# Altium project Zulu_a7_no_pmod.PrjPcb (part 3 of 3)

## Sheet zulu_a7_5.SchDoc
size 277 x 341 mm; Author: Christian Tambe; VERSION#: 1.0; Origin: Eagle; OriginPath: C:\Users\tambe\Documents\Electronics\Zulu_A7\Zulu_Altrium\zulu_a7.sch; OriginSheet: 6; OriginDescription: FPGA Connections
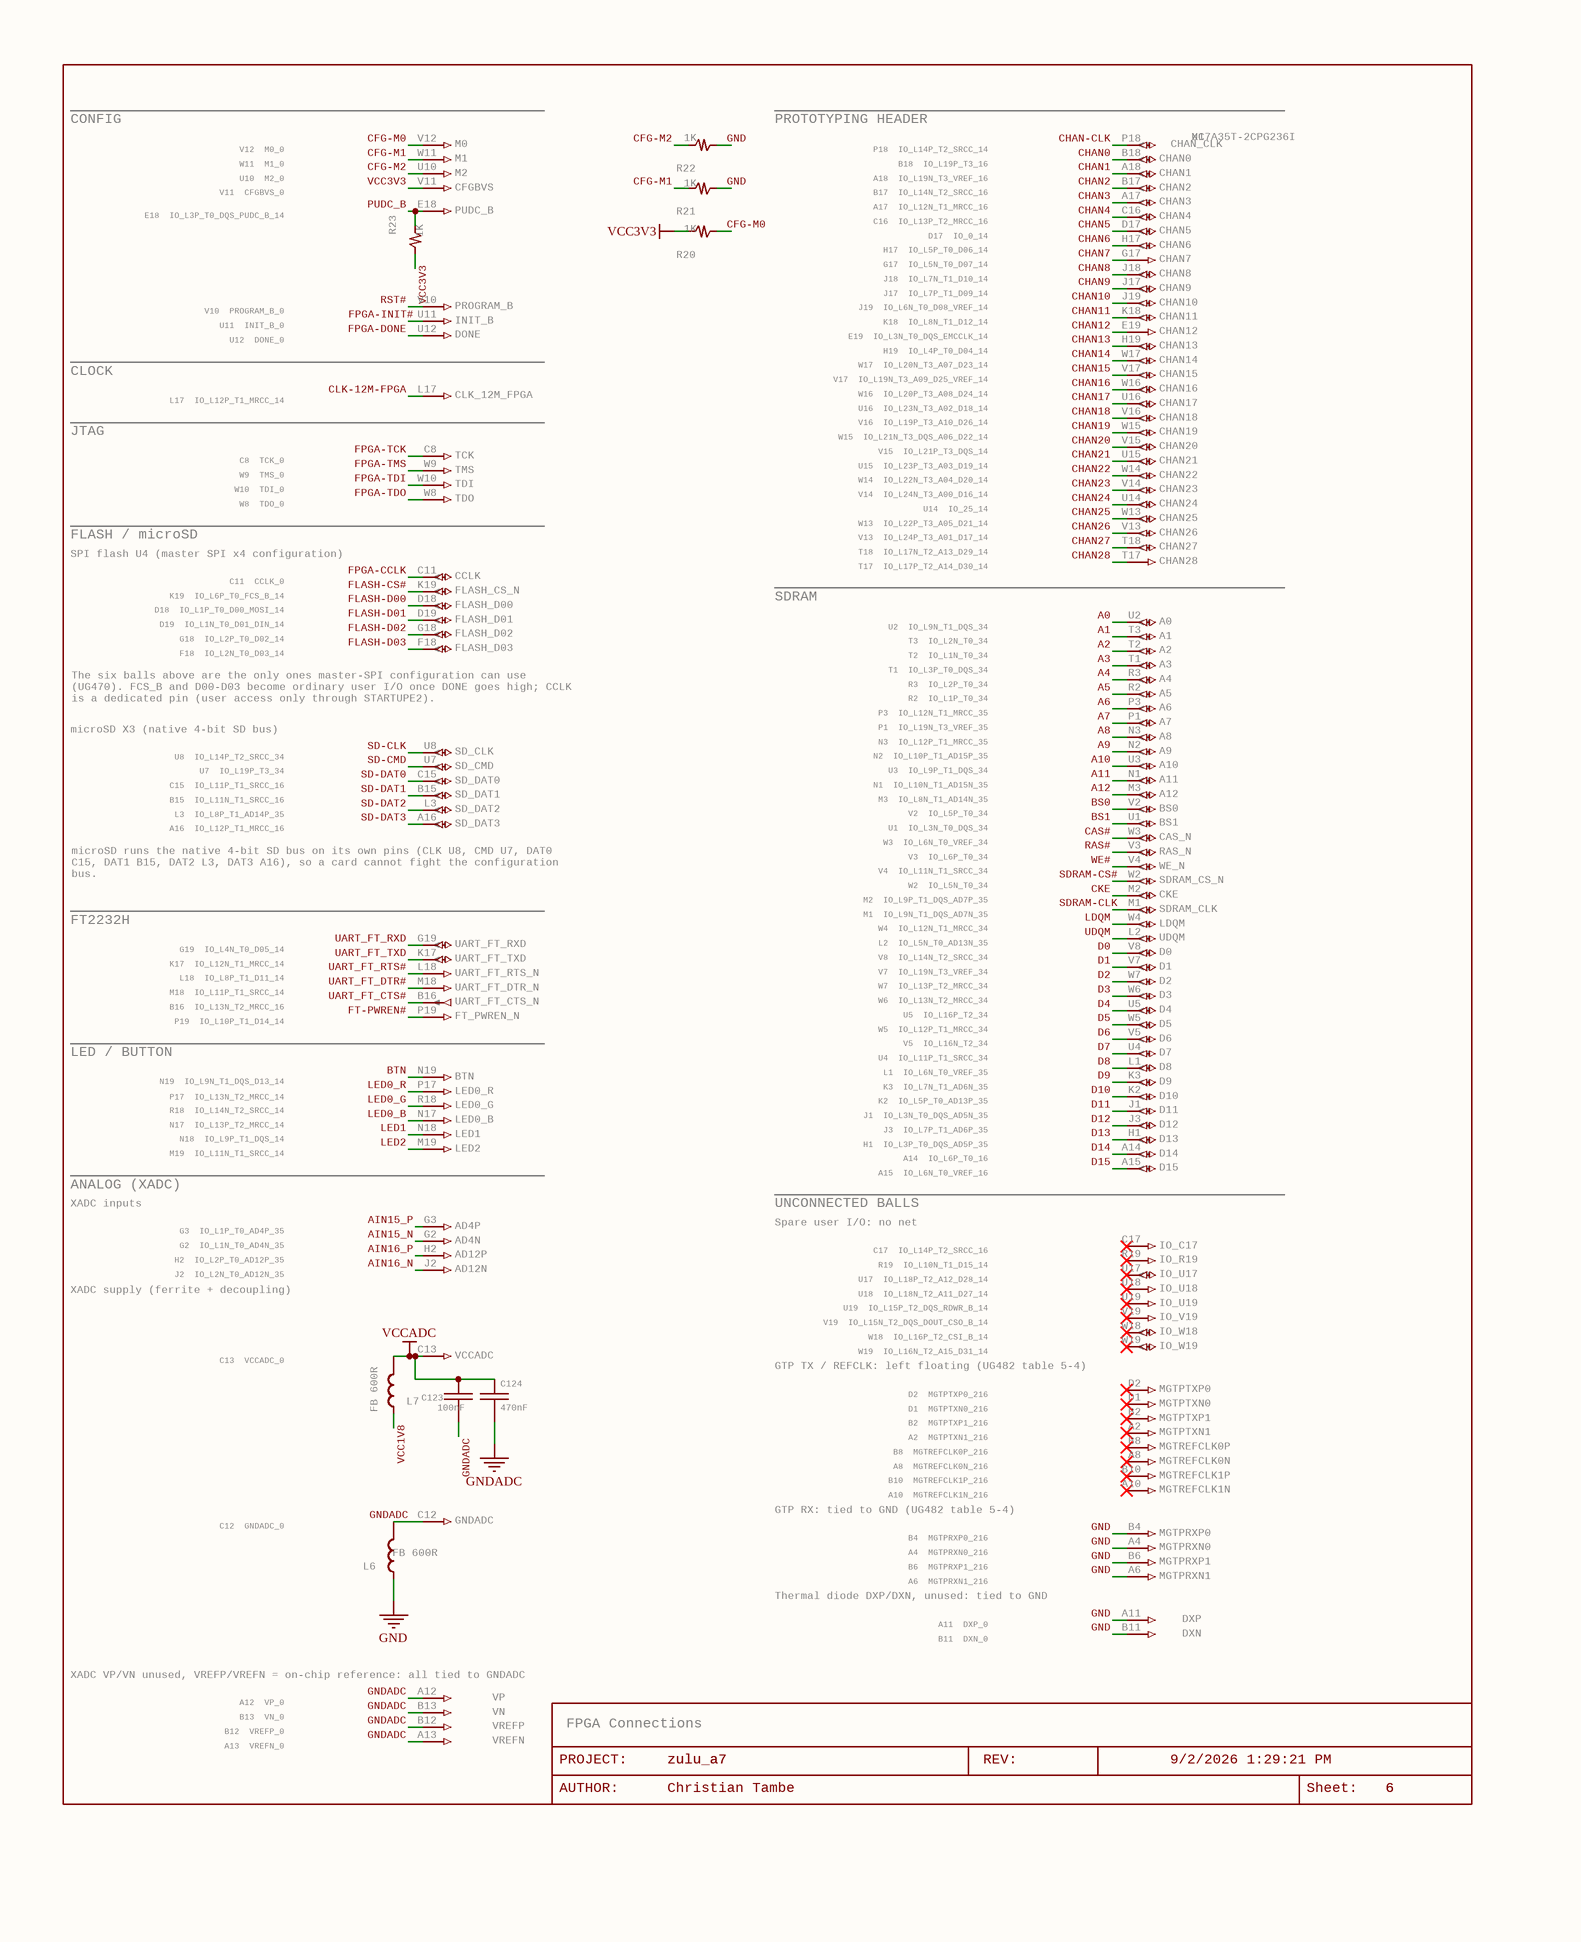
[diagram p5: zulu_a7_5.SchDoc]

### Parts
C123  100nF  [C0201]
C124  470nF  [C0402]
FRAME2  LAST_DATE_TIME: 9/2/2026 1:29:21 PM  Sheet: Sheet:  SHEET: 6  REV: REV:  PROJECT: PROJECT:  DRAWING_NAME: zulu_a7  AUTHOR: Christian Tambe  (hidden comment: DOCFIELD)  (graphical)
L6  FB 600R  [IND0603]
L7  FB 600R  [IND0603]
R20  1K  [R0201]
R21  1K  [R0402]
R22  1K  [R0201]
R23  1K  [R0201]
U1  PART: U1  [XC7A35T-CPG236]  (hidden comment: XC7A35T-2CPG236I)  (parts D,E,F,G,H,I,J,K,L,M,N,O,P,Q,R,S,T,U,V,W,X,Y,Z,27,28,29,30,31,32,33,34,35,36,37,38,39,40,41,42,43,44,45,46,47,48,49,50,51,52,53,54,55,56,57,58,59,60,61,62,63,64,65,66,67,68,69,70,71,72,73,74,75,76,77,78,79,80,81,82,83,84,85,86,87,88,89,90,91,92,93,94,95,96,97,98,99,100,101,102,103,104,105,106,107,108,109,110,111,112,113,114,115,116,117,118,119,120,121,122,123,124,125,126,127,128,129,130,131,132,133,134,135,136,137,138,139,140,141,142 of 142)

### Nets
GND: L6.1 R21.1 R22.1 U1.A4 U1.A6 U1.A11 U1.B4 U1.B6 U1.B11
GNDADC: C123.2 C124.2 L6.2 U1.A12 U1.A13 U1.B12 U1.B13 U1.C12
VCC1V8: L7.1
VCC3V3: R20.2 R23.1 U1.V11
VCCADC: C123.1 C124.1 L7.2 U1.C13
A0: U1.U2
A1: U1.T3
A2: U1.T2
A3: U1.T1
A4: U1.R3
A5: U1.R2
A6: U1.P3
A7: U1.P1
A8: U1.N3
A9: U1.N2
A10: U1.U3
A11: U1.N1
A12: U1.M3
AIN15_N: U1.G2
AIN15_P: U1.G3
AIN16_N: U1.J2
AIN16_P: U1.H2
BS0: U1.V2
BS1: U1.U1
BTN: U1.N19
CAS#: U1.W3
CFG-M0: R20.1 U1.V12
CFG-M1: R21.2 U1.W11
CFG-M2: R22.2 U1.U10
CHAN0: U1.B18
CHAN1: U1.A18
CHAN2: U1.B17
CHAN3: U1.A17
CHAN4: U1.C16
CHAN5: U1.D17
CHAN6: U1.H17
CHAN7: U1.G17
CHAN8: U1.J18
CHAN9: U1.J17
CHAN10: U1.J19
CHAN11: U1.K18
CHAN12: U1.E19
CHAN13: U1.H19
CHAN14: U1.W17
CHAN15: U1.V17
CHAN16: U1.W16
CHAN17: U1.U16
CHAN18: U1.V16
CHAN19: U1.W15
CHAN20: U1.V15
CHAN21: U1.U15
CHAN22: U1.W14
CHAN23: U1.V14
CHAN24: U1.U14
CHAN25: U1.W13
CHAN26: U1.V13
CHAN27: U1.T18
CHAN28: U1.T17
CHAN-CLK: U1.P18
CKE: U1.M2
CLK-12M-FPGA: U1.L17
D0: U1.V8
D1: U1.V7
D2: U1.W7
D3: U1.W6
D4: U1.U5
D5: U1.W5
D6: U1.V5
D7: U1.U4
D8: U1.L1
D9: U1.K3
D10: U1.K2
D11: U1.J1
D12: U1.J3
D13: U1.H1
D14: U1.A14
D15: U1.A15
FLASH-CS#: U1.K19
FLASH-D00: U1.D18
FLASH-D01: U1.D19
FLASH-D02: U1.G18
FLASH-D03: U1.F18
FPGA-CCLK: U1.C11
FPGA-DONE: U1.U12
FPGA-INIT#: U1.U11
FPGA-TCK: U1.C8
FPGA-TDI: U1.W10
FPGA-TDO: U1.W8
FPGA-TMS: U1.W9
FT-PWREN#: U1.P19
LDQM: U1.W4
LED0_B: U1.N17
LED0_G: U1.R18
LED0_R: U1.P17
LED1: U1.N18
LED2: U1.M19
PUDC_B: R23.2 U1.E18
RAS#: U1.V3
RST#: U1.V10
SD-CLK: U1.U8
SD-CMD: U1.U7
SD-DAT0: U1.C15
SD-DAT1: U1.B15
SD-DAT2: U1.L3
SD-DAT3: U1.A16
SDRAM-CLK: U1.M1
SDRAM-CS#: U1.W2
UART_FT_CTS#: U1.B16
UART_FT_DTR#: U1.M18
UART_FT_RTS#: U1.L18
UART_FT_RXD: U1.G19
UART_FT_TXD: U1.K17
UDQM: U1.L2
WE#: U1.V4

Not connected (* = marked no-connect by the designer): U1 A2(1)* A8(1)* A10(1)* B2(1)* B8(1)* B10(1)* C17(1)* D1(1)* D2(1)* R19(1)* U17(1)* U18(1)* U19(1)* V19(1)* W18(1)* W19(1)*

### Notes on the sheet
- CONFIG
- V12  M0_0
- W11  M1_0
- U10  M2_0
- PROTOTYPING HEADER
- B18  IO_L19P_T3_16
- A18  IO_L19N_T3_VREF_16
- P18  IO_L14P_T2_SRCC_14
- V11  CFGBVS_0
- E18  IO_L3P_T0_DQS_PUDC_B_14
- B17  IO_L14N_T2_SRCC_16
- A17  IO_L12N_T1_MRCC_16
- C16  IO_L13P_T2_MRCC_16
- D17  IO_0_14
- H17  IO_L5P_T0_D06_14
- V10  PROGRAM_B_0
- J18  IO_L7N_T1_D10_14
- J17  IO_L7P_T1_D09_14
- J19  IO_L6N_T0_D08_VREF_14
- K18  IO_L8N_T1_D12_14
- G17  IO_L5N_T0_D07_14
- CLOCK
- U12  DONE_0
- U11  INIT_B_0
- H19  IO_L4P_T0_D04_14
- W17  IO_L20N_T3_A07_D23_14
- V17  IO_L19N_T3_A09_D25_VREF_14
- W16  IO_L20P_T3_A08_D24_14
- E19  IO_L3N_T0_DQS_EMCCLK_14
- JTAG
- C8  TCK_0
- L17  IO_L12P_T1_MRCC_14
- U16  IO_L23N_T3_A02_D18_14
- V16  IO_L19P_T3_A10_D26_14
- W15  IO_L21N_T3_DQS_A06_D22_14
- V15  IO_L21P_T3_DQS_14
- U15  IO_L23P_T3_A03_D19_14
- W8  TDO_0
- W9  TMS_0
- W10  TDI_0
- W14  IO_L22N_T3_A04_D20_14
- V14  IO_L24N_T3_A00_D16_14
- U14  IO_25_14
- W13  IO_L22P_T3_A05_D21_14
- V13  IO_L24P_T3_A01_D17_14
- FLASH / microSD
- SPI flash U4 (master SPI x4 configuration)
- C11  CCLK_0
- D18  IO_L1P_T0_D00_MOSI_14
- K19  IO_L6P_T0_FCS_B_14
- SDRAM
- T18  IO_L17N_T2_A13_D29_14
- T17  IO_L17P_T2_A14_D30_14
- D19  IO_L1N_T0_D01_DIN_14
- G18  IO_L2P_T0_D02_14
- F18  IO_L2N_T0_D03_14
- U2  IO_L9N_T1_DQS_34
- T3  IO_L2N_T0_34
- T1  IO_L3P_T0_DQS_34
- T2  IO_L1N_T0_34
- R3  IO_L2P_T0_34
- microSD X3 (native 4-bit SD bus)
- (near U1) The six balls above are the only ones master-SPI configuration can use (UG470). FCS_B and D00-D03 become ordinary user I/O once DONE goes high; CCLK is a dedicated pin (user access only through STARTUPE2).
- P1  IO_L19N_T3_VREF_35
- R2  IO_L1P_T0_34
- P3  IO_L12N_T1_MRCC_35
- N3  IO_L12P_T1_MRCC_35
- L3  IO_L8P_T1_AD14P_35
- B15  IO_L11N_T1_SRCC_16
- U8  IO_L14P_T2_SRCC_34
- U7  IO_L19P_T3_34
- C15  IO_L11P_T1_SRCC_16
- U3  IO_L9P_T1_DQS_34
- U1  IO_L3N_T0_DQS_34
- V2  IO_L5P_T0_34
- N2  IO_L10P_T1_AD15P_35
- N1  IO_L10N_T1_AD15N_35
- M3  IO_L8N_T1_AD14N_35
- A16  IO_L12P_T1_MRCC_16
- W3  IO_L6N_T0_VREF_34
- V3  IO_L6P_T0_34
- V4  IO_L11N_T1_SRCC_34
- W2  IO_L5N_T0_34
- FT2232H
- (near U1) microSD runs the native 4-bit SD bus on its own pins (CLK U8, CMD U7, DAT0 C15, DAT1 B15, DAT2 L3, DAT3 A16), so a card cannot fight the configuration bus.
- K17  IO_L12N_T1_MRCC_14
- G19  IO_L4N_T0_D05_14
- V8  IO_L14N_T2_SRCC_34
- V7  IO_L19N_T3_VREF_34
- W4  IO_L12N_T1_MRCC_34
- M1  IO_L9N_T1_DQS_AD7N_35
- L2  IO_L5N_T0_AD13N_35
- M2  IO_L9P_T1_DQS_AD7P_35
- B16  IO_L13N_T2_MRCC_16
- L18  IO_L8P_T1_D11_14
- M18  IO_L11P_T1_SRCC_14
- P19  IO_L10P_T1_D14_14
- W7  IO_L13P_T2_MRCC_34
- W6  IO_L13N_T2_MRCC_34
- U5  IO_L16P_T2_34
- W5  IO_L12P_T1_MRCC_34
- LED / BUTTON
- N19  IO_L9N_T1_DQS_D13_14
- R18  IO_L14N_T2_SRCC_14
- P17  IO_L13N_T2_MRCC_14
- V5  IO_L16N_T2_34
- U4  IO_L11P_T1_SRCC_34
- L1  IO_L6N_T0_VREF_35
- K3  IO_L7N_T1_AD6N_35
- K2  IO_L5P_T0_AD13P_35
- J1  IO_L3N_T0_DQS_AD5N_35
- N18  IO_L9P_T1_DQS_14
- M19  IO_L11N_T1_SRCC_14
- N17  IO_L13P_T2_MRCC_14
- J3  IO_L7P_T1_AD6P_35
- H1  IO_L3P_T0_DQS_AD5P_35
- A14  IO_L6P_T0_16
- A15  IO_L6N_T0_VREF_16
- ANALOG (XADC)
- XADC inputs
- G3  IO_L1P_T0_AD4P_35
- G2  IO_L1N_T0_AD4N_35
- UNCONNECTED BALLS
- Spare user I/O: no net
- C17  IO_L14P_T2_SRCC_16
- XADC supply (ferrite + decoupling)
- H2  IO_L2P_T0_AD12P_35
- J2  IO_L2N_T0_AD12N_35
- U18  IO_L18N_T2_A11_D27_14
- U19  IO_L15P_T2_DQS_RDWR_B_14
- V19  IO_L15N_T2_DQS_DOUT_CSO_B_14
- R19  IO_L10N_T1_D15_14
- U17  IO_L18P_T2_A12_D28_14
- C13  VCCADC_0
- GTP TX / REFCLK: left floating (UG482 table 5-4)
- W19  IO_L16N_T2_A15_D31_14
- W18  IO_L16P_T2_CSI_B_14
- D2  MGTPTXP0_216
- D1  MGTPTXN0_216
- B2  MGTPTXP1_216
- B8  MGTREFCLK0P_216
- A8  MGTREFCLK0N_216
- A2  MGTPTXN1_216
- C12  GNDADC_0
- GTP RX: tied to GND (UG482 table 5-4)
- B10  MGTREFCLK1P_216
- A10  MGTREFCLK1N_216
- B4  MGTPRXP0_216
- Thermal diode DXP/DXN, unused: tied to GND
- A4  MGTPRXN0_216
- B6  MGTPRXP1_216
- A6  MGTPRXN1_216
- (near U1) XADC VP/VN unused, VREFP/VREFN = on-chip reference: all tied to GNDADC
- A11  DXP_0
- B11  DXN_0
- A12  VP_0
- B13  VN_0
- B12  VREFP_0
- A13  VREFN_0
- (near FRAME2) FPGA Connections
- (near FRAME2) AUTHOR:

### Library data of the parts
C123 = C-USC0201: CAPACITOR, American symbol; GateName_1: G$1; SymbolName_1: C-US; MANF: Murata; MANF#: GRM033R61A104KE15D; SPEC: X5R 10V +-10% 0201 0.1uF, 0.30 mm max -- moved 2026-09-16 from the L7 bead to U1's VCCADC/GNDADC balls: UG480 Fig 6-1 Note 1 puts the 100 nF as close as possible to the package balls, the 470 nF (C124) at the bead; DeviceName: C0201; LibraryName: rcl; DeviceSetName: C-US
C124 = C-USC0402: CAPACITOR, American symbol; GateName_1: G$1; SymbolName_1: C-US; MANF: Samsung; MANF#: CL05A474KO5NNNC; SPEC: X5R 16V +-10% 0402 0.47uF, 0.55 mm max; replaced GRM155R61C474KA88D (a number no distributor knows) on 2026-09-07; DeviceName: C0402; LibraryName: rcl; DeviceSetName: C-US
FRAME2 = DOCFIELD: DOCUMENT FIELD; GateName_1: G$1; SymbolName_1: DOCFIELD; LibraryName: ctambe; DeviceSetName: DOCFIELD
L6 L7 = INDUCTOR: INDUCTOR, generic power inductor; GateName_1: G$1; MANF: Murata; MANF#: BLM18KG601SN1D; SPEC: ferrite bead 600 ohm at 100 MHz +-25%, 1.3 A at 85 C, 0.15 ohm max, 0603, 0.90 mm max; replaced BLM18PG601SN1D (a number Murata never made; the spec 600 ohm/1.5 A is BLM18SP601SN1D) on 2026-09-08; L4/L5 feed the FT2232H VPHY/VPLL (60 mA max), L6 GNDADC, L7 VCCADC (25 mA); SymbolName_1: INDUCTOR; LibraryName: ctambe; DeviceSetName: INDUCTOR
R20 R22 R23 = R-US_SMALLR0201: RESISTOR, American symbol, small 2-zigzag variant (sheet 2 only); GateName_1: G$1; MANF: Yageo; MANF#: RC0201FR-071KL; SPEC: thick film +-1%, 1/20W, 0201; SymbolName_1: R-US_SMALL; DeviceName: R0201; LibraryName: rcl; DeviceSetName: R-US_SMALL
R21 = R-US_SMALLR0402: RESISTOR, American symbol, small 2-zigzag variant (sheet 2 only); GateName_1: G$1; MANF: Yageo; MANF#: RC0402FR-071KL; SPEC: thick film +-1%, 1/16W, 0402; SymbolName_1: R-US_SMALL; DeviceName: R0402; LibraryName: rcl; DeviceSetName: R-US_SMALL
U1 = XC7A35T-CPG236-1CPG236C: Xilinx Artix-7 XC7A35T-2CPG236I   Replacement for the Spartan-6 XC6SLX25-FT256. See design notes: SDRAM/microSD/GPIO ball assignments verified against Digilent Cmod A7-35T (same device+package); config/JTAG/power ball assignments are functionally correct placeholders pending verification against the official Xilinx pinout file.; GateName_1: PWR; SymbolName_1: A7_PWR; GateName_2: GND; SymbolName_2: A7_GND; GateName_3: BANK216; SymbolName_3: A7_BANK216; GateName_4: PART_VALUE; SymbolName_4: PV_GATE; GateName_5: SDRAM_A0; SymbolName_5: PIN_GATE_IO; GateName_6: SDRAM_A1; GateName_7: SDRAM_A2; GateName_8: SDRAM_A3; GateName_9: SDRAM_A4; GateName_10: SDRAM_A5; GateName_11: SDRAM_A6; GateName_12: SDRAM_A7; GateName_13: SDRAM_A8; GateName_14: SDRAM_A9; GateName_15: SDRAM_A10; GateName_16: SDRAM_A11; GateName_17: SDRAM_A12; GateName_18: SDRAM_BA0; GateName_19: SDRAM_BA1; GateName_20: SDRAM_CAS#; GateName_21: SDRAM_RAS#; GateName_22: SDRAM_WE#; GateName_23: SDRAM_CS#; GateName_24: SDRAM_CKE; GateName_25: SDRAM_CLK; GateName_26: SDRAM_LDQM; GateName_27: SDRAM_UDQM; GateName_28: SDRAM_DQ0; GateName_29: SDRAM_DQ1; GateName_30: SDRAM_DQ2; GateName_31: SDRAM_DQ3; GateName_32: SDRAM_DQ4; GateName_33: SDRAM_DQ5; GateName_34: SDRAM_DQ6; GateName_35: SDRAM_DQ7; GateName_36: SDRAM_DQ8; GateName_37: SDRAM_DQ9; GateName_38: SDRAM_DQ10; GateName_39: SDRAM_DQ11; GateName_40: SDRAM_DQ12; GateName_41: SDRAM_DQ13; GateName_42: SDRAM_DQ14; GateName_43: SDRAM_DQ15; GateName_44: SPI_SPI_CCLK; GateName_45: SPI_D00_MOSI; GateName_46: SPI_D01_DIN; GateName_47: SPI_FCS_B; GateName_48: SD_DAT3; GateName_49: SD_DAT2; GateName_50: SD_DAT1; GateName_51: CHAN0; GateName_52: CHAN1; GateName_53: CHAN2; GateName_54: CHAN3; GateName_55: CHAN4; GateName_56: CHAN5; GateName_57: CHAN6; GateName_58: CHAN7; GateName_59: CHAN8; GateName_60: CHAN9; GateName_61: CHAN10; GateName_62: CHAN11; GateName_63: IO_W7; GateName_64: CHAN12; GateName_65: CHAN13; GateName_66: CHAN14; GateName_67: CHAN15; GateName_68: CHAN16; GateName_69: CHAN17; GateName_70: CHAN18; GateName_71: CHAN19; GateName_72: CHAN20; GateName_73: CHAN21; GateName_74: CHAN22; GateName_75: CHAN23; GateName_76: CHAN24; GateName_77: CHAN25; GateName_78: CHAN26; GateName_79: CHAN27; GateName_80: UART_CTS; SymbolName_80: PIN_GATE_OUT; GateName_81: CHAN-CLK; GateName_82: XADC_P; SymbolName_82: PIN_GATE_IN; GateName_83: USB_PWREN; GateName_84: XADC_N; GateName_85: CLK12M; GateName_86: UART_TXD; GateName_87: UART_RXD; GateName_88: PROGRAM_B; GateName_89: INIT_B; GateName_90: DONE; GateName_91: TCK; GateName_92: TMS; GateName_93: TDI; GateName_94: TDO; GateName_95: M0; GateName_96: M1; GateName_97: M2; GateName_98: CFGBVS; GateName_99: PUDC_B; GateName_100: MGTPRXP0; GateName_101: MGTPRXN0; GateName_102: MGTPRXP1; GateName_103: MGTPRXN1; GateName_104: GNDADC; GateName_105: VCCADC; GateName_106: VP; GateName_107: VN; GateName_108: VREFP; GateName_109: VREFN; GateName_110: DXP; GateName_111: DXN; GateName_112: MGTPTXP0; GateName_113: MGTPTXN0; GateName_114: MGTPTXP1; GateName_115: MGTREFCLK0P; GateName_116: MGTREFCLK0N; GateName_117: MGTREFCLK1P; GateName_118: MGTREFCLK1N; GateName_119: MGTPTXN1; GateName_120: CHAN28; GateName_121: LED2; GateName_122: LED0_R; GateName_123: IO_A14; GateName_124: IO_A15; GateName_125: IO_A16; GateName_126: LED1; GateName_127: BTN; GateName_128: SD_DAT0; GateName_129: LED0_G; GateName_130: IO_W19; GateName_131: LED0_B; GateName_132: IO_C15; GateName_133: IO_B15; GateName_134: SD_CLK; GateName_135: UART_RTS; GateName_136: IO_N2; GateName_137: SD_CMD; GateName_138: UART_DTR; GateName_139: SPI_D03; GateName_140: SPI_D02; GateName_141: XADC1_P; GateName_142: XADC1_N; MANF: AMD/Xilinx; SymbolName_6: PIN_GATE_IO; SymbolName_7: PIN_GATE_IO; SymbolName_8: PIN_GATE_IO; SymbolName_9: PIN_GATE_IO; SymbolName_10: PIN_GATE_IO; SymbolName_11: PIN_GATE_IO; SymbolName_12: PIN_GATE_IO; SymbolName_13: PIN_GATE_IO; SymbolName_14: PIN_GATE_IO; SymbolName_15: PIN_GATE_IO; SymbolName_16: PIN_GATE_IO; SymbolName_17: PIN_GATE_IO; SymbolName_18: PIN_GATE_IO; SymbolName_19: PIN_GATE_IO; SymbolName_20: PIN_GATE_IO; SymbolName_21: PIN_GATE_IO; SymbolName_22: PIN_GATE_IO; SymbolName_23: PIN_GATE_IO; SymbolName_24: PIN_GATE_IO; SymbolName_25: PIN_GATE_IO; SymbolName_26: PIN_GATE_IO; SymbolName_27: PIN_GATE_IO; SymbolName_28: PIN_GATE_IO; SymbolName_29: PIN_GATE_IO; SymbolName_30: PIN_GATE_IO; SymbolName_31: PIN_GATE_IO; SymbolName_32: PIN_GATE_IO; SymbolName_33: PIN_GATE_IO; SymbolName_34: PIN_GATE_IO; SymbolName_35: PIN_GATE_IO; SymbolName_36: PIN_GATE_IO; SymbolName_37: PIN_GATE_IO; SymbolName_38: PIN_GATE_IO; SymbolName_39: PIN_GATE_IO; SymbolName_40: PIN_GATE_IO; SymbolName_41: PIN_GATE_IO; SymbolName_42: PIN_GATE_IO; SymbolName_43: PIN_GATE_IO; SymbolName_44: PIN_GATE_IO; SymbolName_45: PIN_GATE_IO; SymbolName_46: PIN_GATE_IO; SymbolName_47: PIN_GATE_IO; SymbolName_48: PIN_GATE_IO; SymbolName_49: PIN_GATE_IO; SymbolName_50: PIN_GATE_IO; SymbolName_51: PIN_GATE_IO; SymbolName_52: PIN_GATE_IO; SymbolName_53: PIN_GATE_IO; SymbolName_54: PIN_GATE_IO; SymbolName_55: PIN_GATE_IO; SymbolName_56: PIN_GATE_IO; SymbolName_57: PIN_GATE_IO; SymbolName_58: PIN_GATE_IO; SymbolName_59: PIN_GATE_IO; SymbolName_60: PIN_GATE_IO; SymbolName_61: PIN_GATE_IO; SymbolName_62: PIN_GATE_IO; SymbolName_63: PIN_GATE_IO; SymbolName_64: PIN_GATE_IO; SymbolName_65: PIN_GATE_IO; SymbolName_66: PIN_GATE_IO; SymbolName_67: PIN_GATE_IO; SymbolName_68: PIN_GATE_IO; SymbolName_69: PIN_GATE_IO; SymbolName_70: PIN_GATE_IO; SymbolName_71: PIN_GATE_IO; SymbolName_72: PIN_GATE_IO; SymbolName_73: PIN_GATE_IO; SymbolName_74: PIN_GATE_IO; SymbolName_75: PIN_GATE_IO; SymbolName_76: PIN_GATE_IO; SymbolName_77: PIN_GATE_IO; SymbolName_78: PIN_GATE_IO; SymbolName_79: PIN_GATE_IO; SymbolName_81: PIN_GATE_IO; SymbolName_83: PIN_GATE_IN; SymbolName_84: PIN_GATE_IN; SymbolName_85: PIN_GATE_IN; SymbolName_86: PIN_GATE_IO; SymbolName_87: PIN_GATE_IO; SymbolName_88: PIN_GATE_IN; SymbolName_89: PIN_GATE_IN; SymbolName_90: PIN_GATE_IN; SymbolName_91: PIN_GATE_IN; SymbolName_92: PIN_GATE_IN; SymbolName_93: PIN_GATE_IN; SymbolName_94: PIN_GATE_IN; SymbolName_95: PIN_GATE_IN; SymbolName_96: PIN_GATE_IN; SymbolName_97: PIN_GATE_IN; SymbolName_98: PIN_GATE_IN; SymbolName_99: PIN_GATE_IN; SymbolName_100: PIN_GATE_IN; SymbolName_101: PIN_GATE_IN; SymbolName_102: PIN_GATE_IN; SymbolName_103: PIN_GATE_IN; SymbolName_104: PIN_GATE_IN; SymbolName_105: PIN_GATE_IN; SymbolName_106: PIN_GATE_IN; SymbolName_107: PIN_GATE_IN; SymbolName_108: PIN_GATE_IN; SymbolName_109: PIN_GATE_IN; SymbolName_110: PIN_GATE_IN; SymbolName_111: PIN_GATE_IN; SymbolName_112: PIN_GATE_IN; SymbolName_113: PIN_GATE_IN; SymbolName_114: PIN_GATE_IN; SymbolName_115: PIN_GATE_IN; SymbolName_116: PIN_GATE_IN; SymbolName_117: PIN_GATE_IN; SymbolName_118: PIN_GATE_IN; SymbolName_119: PIN_GATE_IN; SymbolName_120: PIN_GATE_IN; SymbolName_121: PIN_GATE_IN; SymbolName_122: PIN_GATE_IN; SymbolName_123: PIN_GATE_IN; SymbolName_124: PIN_GATE_IN; SymbolName_125: PIN_GATE_IN; SymbolName_126: PIN_GATE_IN; SymbolName_127: PIN_GATE_IN; SymbolName_128: PIN_GATE_IO; SymbolName_129: PIN_GATE_IN; SymbolName_130: PIN_GATE_IN; SymbolName_131: PIN_GATE_IN; SymbolName_132: PIN_GATE_IN; SymbolName_133: PIN_GATE_IN; SymbolName_134: PIN_GATE_IO; SymbolName_135: PIN_GATE_IN; SymbolName_136: PIN_GATE_IN; SymbolName_137: PIN_GATE_IO; SymbolName_138: PIN_GATE_IN; SymbolName_139: PIN_GATE_IO; SymbolName_140: PIN_GATE_IO; SymbolName_141: PIN_GATE_IN; SymbolName_142: PIN_GATE_IN; DeviceName: -2CPG236I; LibraryName: ctambe; DeviceSetName: XC7A35T-CPG236; MANF#: XC7A35T-2CPG236I

## Sheet zulu_a7_6.SchDoc
size 241 x 313 mm; Author: Christian Tambe; VERSION#: 1.0; Origin: Eagle; OriginPath: C:\Users\tambe\Documents\Electronics\Zulu_A7\Zulu_Altrium\zulu_a7.sch; OriginSheet: 7; OriginDescription: FPGA POWER
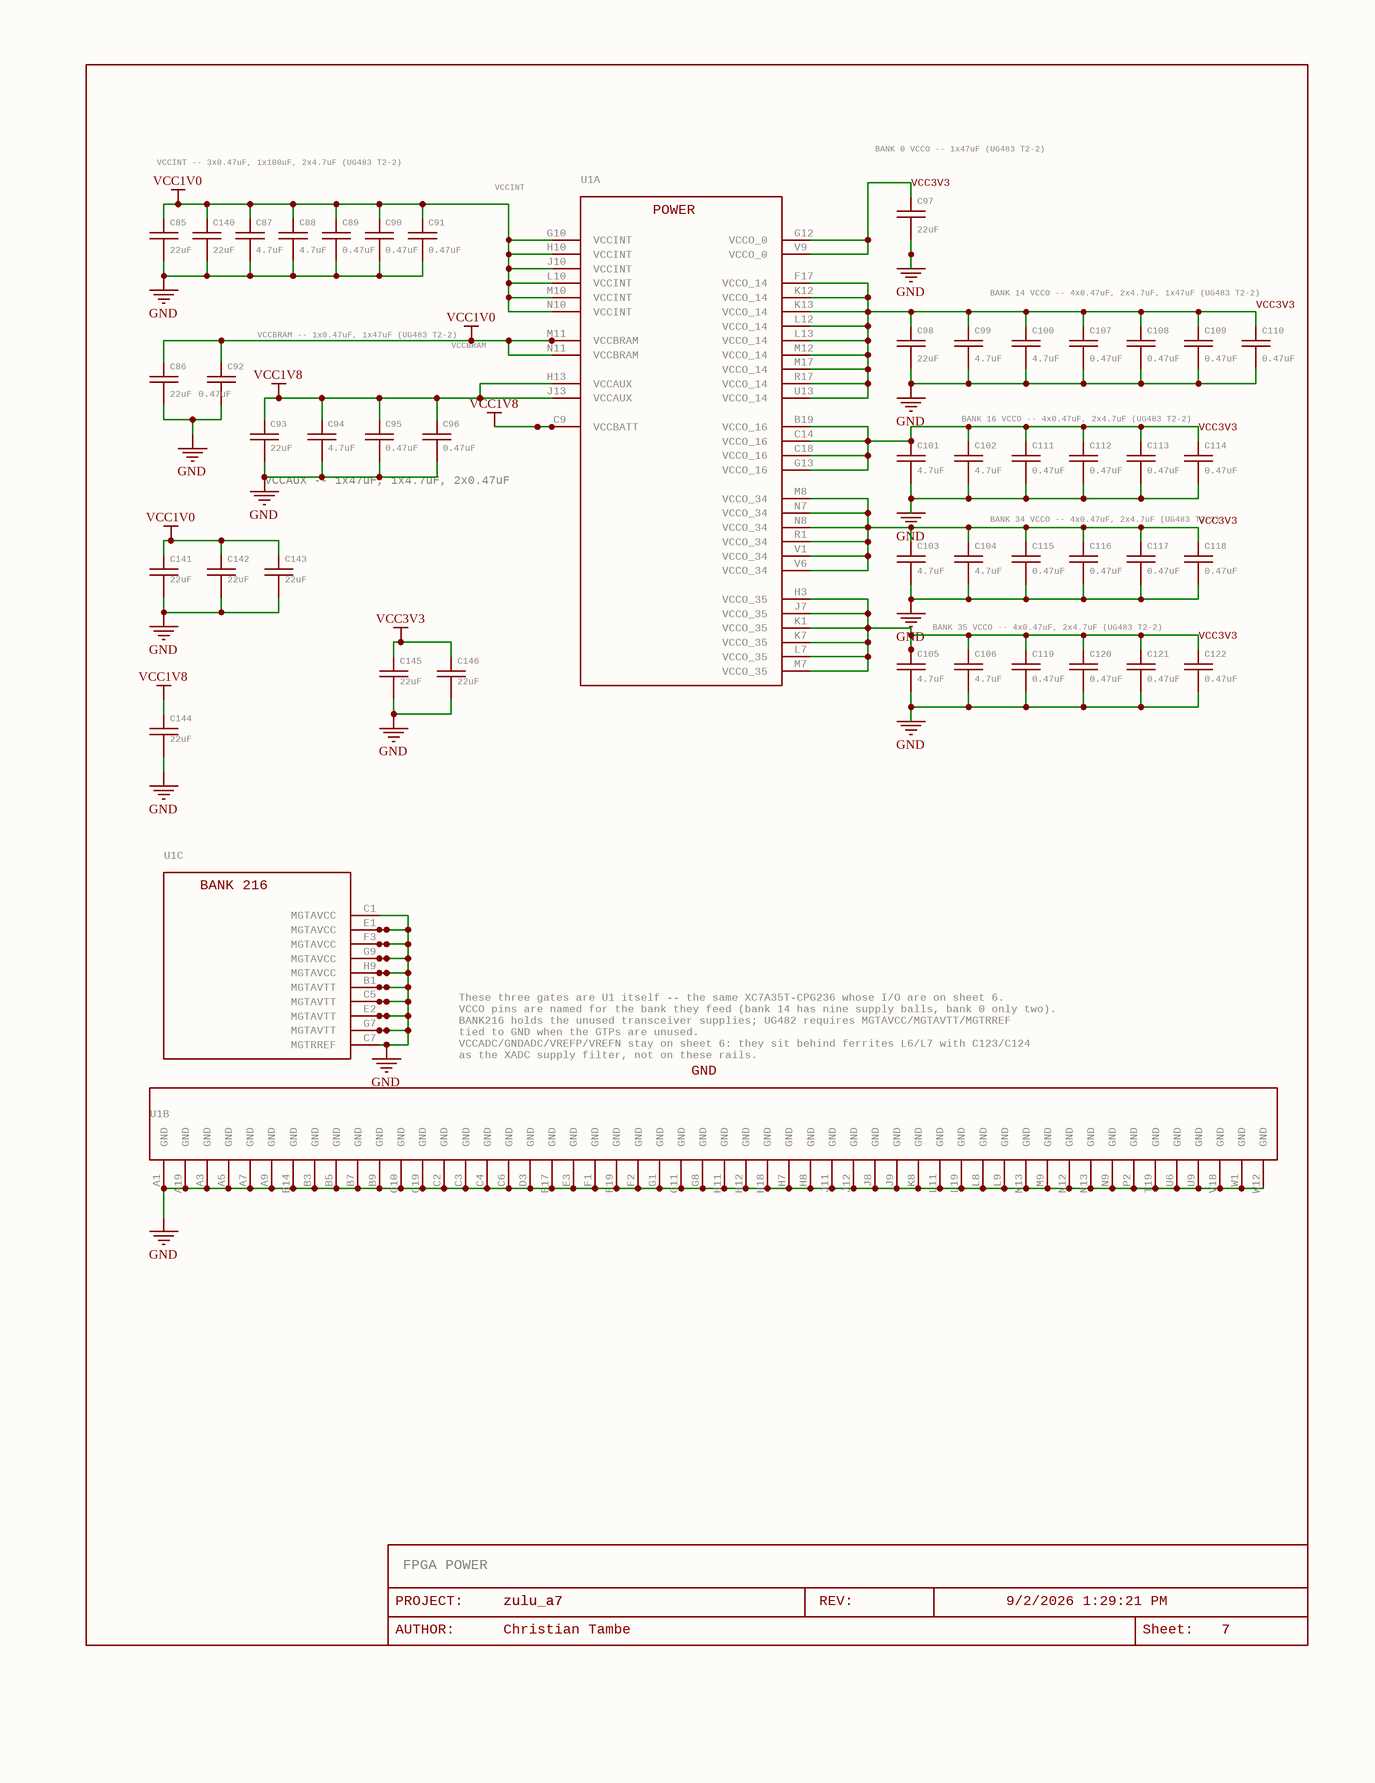
[diagram p6: zulu_a7_6.SchDoc]

### Parts
C85  22uF  [C0805]
C86  22uF  [C0805]
C87  4.7uF  [C0603]
C88  4.7uF  [C0603]
C89  0.47uF  [C0201]
C90  0.47uF  [C0201]
C91  0.47uF  [C0201]
C92  0.47uF  [C0201]
C93  22uF  [C0805]
C94  4.7uF  [C0603]
C95  0.47uF  [C0201]
C96  0.47uF  [C0201]
C97  22uF  [C0805]
C98  22uF  [C0805]
C99  4.7uF  [C0603]
C100  4.7uF  [C0603]
C101  4.7uF  [C0603]
C102  4.7uF  [C0603]
C103  4.7uF  [C0603]
C104  4.7uF  [C0603]
C105  4.7uF  [C0603]
C106  4.7uF  [C0603]
C107  0.47uF  [C0201]
C108  0.47uF  [C0201]
C109  0.47uF  [C0201]
C110  0.47uF  [C0201]
C111  0.47uF  [C0201]
C112  0.47uF  [C0201]
C113  0.47uF  [C0201]
C114  0.47uF  [C0201]
C115  0.47uF  [C0201]
C116  0.47uF  [C0201]
C117  0.47uF  [C0201]
C118  0.47uF  [C0201]
C119  0.47uF  [C0201]
C120  0.47uF  [C0201]
C121  0.47uF  [C0201]
C122  0.47uF  [C0201]
C140  22uF  [C0805]
C141  22uF  [C0805]
C142  22uF  [C0805]
C143  22uF  [C0805]
C144  22uF  [C0805]
C145  22uF  [C0805]
C146  22uF  [C0805]
FRAME6  LAST_DATE_TIME: 9/2/2026 1:29:21 PM  Sheet: Sheet:  SHEET: 7  REV: REV:  PROJECT: PROJECT:  DRAWING_NAME: zulu_a7  AUTHOR: Christian Tambe  (hidden comment: DOCFIELD)  (graphical)
U1  XC7A35T-2CPG236I  [XC7A35T-CPG236]  (value not drawn)  (parts A,B,C of 142)

### Nets
GND: C85.2 C86.2 C87.2 C88.2 C89.2 C90.2 C91.2 C92.2 C93.2 C94.2 C95.2 C96.2 C97.2 C98.2 C99.2 C100.2 C101.2 C102.2 C103.2 C104.2 C105.2 C106.2 C107.2 C108.2 C109.2 C110.2 C111.2 C112.2 C113.2 C114.2 C115.2 C116.2 C117.2 C118.2 C119.2 C120.2 C121.2 C122.2 C140.2 C141.2 C142.2 C143.2 C144.2 C145.2 C146.2 U1.A1(GND) U1.A3(GND) U1.A5(GND) U1.A7(GND) U1.A9(GND) U1.A19(GND) U1.B1(MGTAVTT) U1.B3(GND) U1.B5(GND) U1.B7(GND) U1.B9(GND) U1.B14(GND) U1.C1(MGTAVCC) U1.C2(GND) U1.C3(GND) U1.C4(GND) U1.C5(MGTAVTT) U1.C6(GND) U1.C7(MGTRREF) U1.C10(GND) U1.C19(GND) U1.D3(GND) U1.E1(MGTAVCC) U1.E2(MGTAVTT) U1.E3(GND) U1.E17(GND) U1.F1(GND) U1.F2(GND) U1.F3(MGTAVCC) U1.F19(GND) U1.G1(GND) U1.G7(MGTAVTT) U1.G8(GND) U1.G9(MGTAVCC) U1.G11(GND) U1.H7(GND) U1.H8(GND) U1.H9(MGTAVCC) U1.H11(GND) U1.H12(GND) U1.H18(GND) U1.J8(GND) U1.J9(GND) U1.J11(GND) U1.J12(GND) U1.K8(GND) U1.L8(GND) U1.L9(GND) U1.L11(GND) U1.L19(GND) U1.M9(GND) U1.M13(GND) U1.N9(GND) U1.N12(GND) U1.N13(GND) U1.P2(GND) U1.T19(GND) U1.U6(GND) U1.U9(GND) U1.V18(GND) U1.W1(GND) U1.W12(GND)
VCC1V0: C85.1 C86.1 C87.1 C88.1 C89.1 C90.1 C91.1 C92.1 C140.1 C141.1 C142.1 C143.1 U1.G10(VCCINT) U1.H10(VCCINT) U1.J10(VCCINT) U1.L10(VCCINT) U1.M10(VCCINT) U1.M11(VCCBRAM) U1.N10(VCCINT) U1.N11(VCCBRAM)
VCC1V8: C93.1 C94.1 C95.1 C96.1 C144.1 U1.C9(VCCBATT) U1.H13(VCCAUX) U1.J13(VCCAUX)
VCC3V3: C97.1 C98.1 C99.1 C100.1 C101.1 C102.1 C103.1 C104.1 C105.1 C106.1 C107.1 C108.1 C109.1 C110.1 C111.1 C112.1 C113.1 C114.1 C115.1 C116.1 C117.1 C118.1 C119.1 C120.1 C121.1 C122.1 C145.1 C146.1 U1.B19(VCCO_16) U1.C14(VCCO_16) U1.C18(VCCO_16) U1.F17(VCCO_14) U1.G12(VCCO_0) U1.G13(VCCO_16) U1.H3(VCCO_35) U1.J7(VCCO_35) U1.K1(VCCO_35) U1.K7(VCCO_35) U1.K12(VCCO_14) U1.K13(VCCO_14) U1.L7(VCCO_35) U1.L12(VCCO_14) U1.L13(VCCO_14) U1.M7(VCCO_35) U1.M8(VCCO_34) U1.M12(VCCO_14) U1.M17(VCCO_14) U1.N7(VCCO_34) U1.N8(VCCO_34) U1.R1(VCCO_34) U1.R17(VCCO_14) U1.U13(VCCO_14) U1.V1(VCCO_34) U1.V6(VCCO_34) U1.V9(VCCO_0)

### Notes on the sheet
- (near C97) BANK 0 VCCO -- 1x47uF (UG483 T2-2)
- VCCINT -- 3x0.47uF, 1x100uF, 2x4.7uF (UG483 T2-2)
- VCCINT
- BANK 14 VCCO -- 4x0.47uF, 2x4.7uF, 1x47uF (UG483 T2-2)
- (near C92) VCCBRAM -- 1x0.47uF, 1x47uF (UG483 T2-2)
- VCCBRAM
- BANK 16 VCCO -- 4x0.47uF, 2x4.7uF (UG483 T2-2)
- VCCAUX -- 1x47uF, 1x4.7uF, 2x0.47uF
- BANK 34 VCCO -- 4x0.47uF, 2x4.7uF (UG483 T2-2)
- BANK 35 VCCO -- 4x0.47uF, 2x4.7uF (UG483 T2-2)
- These three gates are U1 itself -- the same XC7A35T-CPG236 whose I/O are on sheet 6.
  VCCO pins are named for the bank they feed (bank 14 has nine supply balls, bank 0 only two).
  BANK216 holds the unused transceiver supplies; UG482 requires MGTAVCC/MGTAVTT/MGTRREF
  tied to GND when the GTPs are unused.
  VCCADC/GNDADC/VREFP/VREFN stay on sheet 6: they sit behind ferrites L6/L7 with C123/C124
  as the XADC supply filter, not on these rails.
- (near FRAME6) FPGA POWER
- (near FRAME6) AUTHOR:

### Library data of the parts
C85 C86 C93 C97 C98 C140 = C-USC0805: CAPACITOR, American symbol; GateName_1: G$1; SymbolName_1: C-US; MANF: Murata; MANF#: GRM21BR61A226ME44L; SPEC: X5R 10V +-20%, 1.45 mm max; DeviceName: C0805; LibraryName: rcl; DeviceSetName: C-US
C87 C88 C94 C99-C106 = C-USC0603: CAPACITOR, American symbol; GateName_1: G$1; SymbolName_1: C-US; MANF: Murata; MANF#: GRM188R61C475KE11D; SPEC: X5R 16V +-10% 0603 4.7uF, 0.95 mm max; 10 V grades (KE15D obsolete, KAAJD NRND) replaced by the 16 V one on 2026-09-08; DeviceName: C0603; LibraryName: rcl; DeviceSetName: C-US
C89-C92 C95 C96 C107-C122 = C-USC0201: CAPACITOR, American symbol; GateName_1: G$1; SymbolName_1: C-US; MANF: Murata; MANF#: GRM033R60J474KE90D; NOTE: 0402 -> 0201 to cut ESL, following Cmod A7. THE VOLTAGE RATING DROPS 16V to 6.3V and that costs real capacitance: on VCC3V3 a 6.3V 0201 sits at 52 percent of rating and DC bias typically removes 60-75 percent of it, against 15-25 percent for the 16V 0402 it replaces. The BOM value is unchanged, so validate.py's UG483 count still passes -- it counts nominal values and cannot see bias derating. Effective decoupling on 3V3 is roughly half what it was. Confirm the MPN suffix and the bias curve against Murata's data before ordering.; SPEC: X5R 6.3V +-10% 0201 0.47uF; KE15D was a typo, KE90D is the live number; DeviceName: C0201; LibraryName: rcl; DeviceSetName: C-US
C141-C146 = C-USC0805: CAPACITOR, American symbol; GateName_1: G$1; SymbolName_1: C-US; MANF: Murata; MANF#: GRM21BR61A226ME44L; NOTE: Second half of a bulk position: each 47uF 1206 became two 22uF 0805. Nominal drops 47 -> 44 uF per position, but the 0805 is 10V where the 1206 was 6.3V, so it derates less under bias and the pair should deliver at least what the single part did. Height also drops 1.60 -> 1.45 mm max, which the back-side budget against the 2.54 mm header standoff cares about.; SPEC: X5R 10V +-20%, 1.45 mm max; DeviceName: C0805; LibraryName: rcl; DeviceSetName: C-US
FRAME6 = DOCFIELD: DOCUMENT FIELD; GateName_1: G$1; SymbolName_1: DOCFIELD; LibraryName: ctambe; DeviceSetName: DOCFIELD
U1 = XC7A35T-CPG236-1CPG236C: as U1 on sheet zulu_a7_5; SymbolName_6: PIN_GATE_IO; SymbolName_7: PIN_GATE_IO; SymbolName_8: PIN_GATE_IO; SymbolName_9: PIN_GATE_IO; SymbolName_10: PIN_GATE_IO; SymbolName_11: PIN_GATE_IO; SymbolName_12: PIN_GATE_IO; SymbolName_13: PIN_GATE_IO; SymbolName_14: PIN_GATE_IO; SymbolName_15: PIN_GATE_IO; SymbolName_16: PIN_GATE_IO; SymbolName_17: PIN_GATE_IO; SymbolName_18: PIN_GATE_IO; SymbolName_19: PIN_GATE_IO; SymbolName_20: PIN_GATE_IO; SymbolName_21: PIN_GATE_IO; SymbolName_22: PIN_GATE_IO; SymbolName_23: PIN_GATE_IO; SymbolName_24: PIN_GATE_IO; SymbolName_25: PIN_GATE_IO; SymbolName_26: PIN_GATE_IO; SymbolName_27: PIN_GATE_IO; SymbolName_28: PIN_GATE_IO; SymbolName_29: PIN_GATE_IO; SymbolName_30: PIN_GATE_IO; SymbolName_31: PIN_GATE_IO; SymbolName_32: PIN_GATE_IO; SymbolName_33: PIN_GATE_IO; SymbolName_34: PIN_GATE_IO; SymbolName_35: PIN_GATE_IO; SymbolName_36: PIN_GATE_IO; SymbolName_37: PIN_GATE_IO; SymbolName_38: PIN_GATE_IO; SymbolName_39: PIN_GATE_IO; SymbolName_40: PIN_GATE_IO; SymbolName_41: PIN_GATE_IO; SymbolName_42: PIN_GATE_IO; SymbolName_43: PIN_GATE_IO; SymbolName_44: PIN_GATE_IO; SymbolName_45: PIN_GATE_IO; SymbolName_46: PIN_GATE_IO; SymbolName_47: PIN_GATE_IO; SymbolName_48: PIN_GATE_IO; SymbolName_49: PIN_GATE_IO; SymbolName_50: PIN_GATE_IO; SymbolName_51: PIN_GATE_IO; SymbolName_52: PIN_GATE_IO; SymbolName_53: PIN_GATE_IO; SymbolName_54: PIN_GATE_IO; SymbolName_55: PIN_GATE_IO; SymbolName_56: PIN_GATE_IO; SymbolName_57: PIN_GATE_IO; SymbolName_58: PIN_GATE_IO; SymbolName_59: PIN_GATE_IO; SymbolName_60: PIN_GATE_IO; SymbolName_61: PIN_GATE_IO; SymbolName_62: PIN_GATE_IO; SymbolName_63: PIN_GATE_IO; SymbolName_64: PIN_GATE_IO; SymbolName_65: PIN_GATE_IO; SymbolName_66: PIN_GATE_IO; SymbolName_67: PIN_GATE_IO; SymbolName_68: PIN_GATE_IO; SymbolName_69: PIN_GATE_IO; SymbolName_70: PIN_GATE_IO; SymbolName_71: PIN_GATE_IO; SymbolName_72: PIN_GATE_IO; SymbolName_73: PIN_GATE_IO; SymbolName_74: PIN_GATE_IO; SymbolName_75: PIN_GATE_IO; SymbolName_76: PIN_GATE_IO; SymbolName_77: PIN_GATE_IO; SymbolName_78: PIN_GATE_IO; SymbolName_79: PIN_GATE_IO; SymbolName_81: PIN_GATE_IO; SymbolName_83: PIN_GATE_IN; SymbolName_84: PIN_GATE_IN; SymbolName_85: PIN_GATE_IN; SymbolName_86: PIN_GATE_IO; SymbolName_87: PIN_GATE_IO; SymbolName_88: PIN_GATE_IN; SymbolName_89: PIN_GATE_IN; SymbolName_90: PIN_GATE_IN; SymbolName_91: PIN_GATE_IN; SymbolName_92: PIN_GATE_IN; SymbolName_93: PIN_GATE_IN; SymbolName_94: PIN_GATE_IN; SymbolName_95: PIN_GATE_IN; SymbolName_96: PIN_GATE_IN; SymbolName_97: PIN_GATE_IN; SymbolName_98: PIN_GATE_IN; SymbolName_99: PIN_GATE_IN; SymbolName_100: PIN_GATE_IN; SymbolName_101: PIN_GATE_IN; SymbolName_102: PIN_GATE_IN; SymbolName_103: PIN_GATE_IN; SymbolName_104: PIN_GATE_IN; SymbolName_105: PIN_GATE_IN; SymbolName_106: PIN_GATE_IN; SymbolName_107: PIN_GATE_IN; SymbolName_108: PIN_GATE_IN; SymbolName_109: PIN_GATE_IN; SymbolName_110: PIN_GATE_IN; SymbolName_111: PIN_GATE_IN; SymbolName_112: PIN_GATE_IN; SymbolName_113: PIN_GATE_IN; SymbolName_114: PIN_GATE_IN; SymbolName_115: PIN_GATE_IN; SymbolName_116: PIN_GATE_IN; SymbolName_117: PIN_GATE_IN; SymbolName_118: PIN_GATE_IN; SymbolName_119: PIN_GATE_IN; SymbolName_120: PIN_GATE_IN; SymbolName_121: PIN_GATE_IN; SymbolName_122: PIN_GATE_IN; SymbolName_123: PIN_GATE_IN; SymbolName_124: PIN_GATE_IN; SymbolName_125: PIN_GATE_IN; SymbolName_126: PIN_GATE_IN; SymbolName_127: PIN_GATE_IN; SymbolName_128: PIN_GATE_IO; SymbolName_129: PIN_GATE_IN; SymbolName_130: PIN_GATE_IN; SymbolName_131: PIN_GATE_IN; SymbolName_132: PIN_GATE_IN; SymbolName_133: PIN_GATE_IN; SymbolName_134: PIN_GATE_IO; SymbolName_135: PIN_GATE_IN; SymbolName_136: PIN_GATE_IN; SymbolName_137: PIN_GATE_IO; SymbolName_138: PIN_GATE_IN; SymbolName_139: PIN_GATE_IO; SymbolName_140: PIN_GATE_IO; SymbolName_141: PIN_GATE_IN; SymbolName_142: PIN_GATE_IN; DeviceName: -2CPG236I; LibraryName: ctambe; DeviceSetName: XC7A35T-CPG236; POWER: POWER; MANF#: XC7A35T-2CPG236I

## Nets that join several sheets
GND: zulu_a7_1 (35 pins), zulu_a7_2 (10 pins), zulu_a7_3 (28 pins), zulu_a7_4 (29 pins), zulu_a7_5 (9 pins), zulu_a7_6 (107 pins)
VCC1V0: zulu_a7_1 (C84.2 L3.2 U7.4), zulu_a7_2 (X2.20), zulu_a7_6 (20 pins)
VCC1V8: zulu_a7_1 (C82.2 C163.1 L2.2 R113.1), zulu_a7_2 (X2.19), zulu_a7_5 (L7.1), zulu_a7_6 (8 pins)
VCC3V3: zulu_a7_1 (5 pins), zulu_a7_2 (6 pins), zulu_a7_3 (32 pins), zulu_a7_4 (31 pins), zulu_a7_5 (R20.2 R23.1 U1.V11), zulu_a7_6 (55 pins)
A0: zulu_a7_3 (U3.23), zulu_a7_5 (U1.U2)
A1: zulu_a7_3 (U3.24), zulu_a7_5 (U1.T3)
A2: zulu_a7_3 (U3.25), zulu_a7_5 (U1.T2)
A3: zulu_a7_3 (U3.26), zulu_a7_5 (U1.T1)
A4: zulu_a7_3 (U3.29), zulu_a7_5 (U1.R3)
A5: zulu_a7_3 (U3.30), zulu_a7_5 (U1.R2)
A6: zulu_a7_3 (U3.31), zulu_a7_5 (U1.P3)
A7: zulu_a7_3 (U3.32), zulu_a7_5 (U1.P1)
A8: zulu_a7_3 (U3.33), zulu_a7_5 (U1.N3)
A9: zulu_a7_3 (U3.34), zulu_a7_5 (U1.N2)
A10: zulu_a7_3 (U3.22), zulu_a7_5 (U1.U3)
A11: zulu_a7_3 (U3.35), zulu_a7_5 (U1.N1)
A12: zulu_a7_3 (U3.36), zulu_a7_5 (U1.M3)
AIN15_N: zulu_a7_2 (C36.1 R13.1), zulu_a7_5 (U1.G2)
AIN15_P: zulu_a7_2 (C36.2 R12.1), zulu_a7_5 (U1.G3)
AIN16_N: zulu_a7_2 (C37.1 R17.1), zulu_a7_5 (U1.J2)
AIN16_P: zulu_a7_2 (C37.2 R16.1), zulu_a7_5 (U1.H2)
BS0: zulu_a7_3 (U3.20), zulu_a7_5 (U1.V2)
BS1: zulu_a7_3 (U3.21), zulu_a7_5 (U1.U1)
BTN: zulu_a7_2 (R85.2), zulu_a7_5 (U1.N19)
CAS#: zulu_a7_3 (U3.17), zulu_a7_5 (U1.W3)
CHAN0: zulu_a7_2 (X2.3), zulu_a7_5 (U1.B18)
CHAN1: zulu_a7_2 (X2.4), zulu_a7_5 (U1.A18)
CHAN2: zulu_a7_2 (X2.5), zulu_a7_5 (U1.B17)
CHAN3: zulu_a7_2 (X2.6), zulu_a7_5 (U1.A17)
CHAN4: zulu_a7_2 (X2.7), zulu_a7_5 (U1.C16)
CHAN5: zulu_a7_2 (X2.8), zulu_a7_5 (U1.D17)
CHAN6: zulu_a7_2 (X2.9), zulu_a7_5 (U1.H17)
CHAN7: zulu_a7_2 (X2.10), zulu_a7_5 (U1.G17)
CHAN8: zulu_a7_2 (X2.11), zulu_a7_5 (U1.J18)
CHAN9: zulu_a7_2 (X2.12), zulu_a7_5 (U1.J17)
CHAN10: zulu_a7_2 (X2.13), zulu_a7_5 (U1.J19)
CHAN11: zulu_a7_2 (X2.14), zulu_a7_5 (U1.K18)
CHAN12: zulu_a7_2 (X2.15), zulu_a7_5 (U1.E19)
CHAN13: zulu_a7_2 (X2.16), zulu_a7_5 (U1.H19)
CHAN14: zulu_a7_2 (X2.24), zulu_a7_5 (U1.W17)
CHAN15: zulu_a7_2 (X2.25), zulu_a7_5 (U1.V17)
CHAN16: zulu_a7_2 (X2.26), zulu_a7_5 (U1.W16)
CHAN17: zulu_a7_2 (X2.27), zulu_a7_5 (U1.U16)
CHAN18: zulu_a7_2 (X2.28), zulu_a7_5 (U1.V16)
CHAN19: zulu_a7_2 (X2.29), zulu_a7_5 (U1.W15)
CHAN20: zulu_a7_2 (X2.30), zulu_a7_5 (U1.V15)
CHAN21: zulu_a7_2 (X2.31), zulu_a7_5 (U1.U15)
CHAN22: zulu_a7_2 (X2.32), zulu_a7_5 (U1.W14)
CHAN23: zulu_a7_2 (X2.33), zulu_a7_5 (U1.V14)
CHAN24: zulu_a7_2 (X2.34), zulu_a7_5 (U1.U14)
CHAN25: zulu_a7_2 (X2.35), zulu_a7_5 (U1.W13)
CHAN26: zulu_a7_2 (X2.36), zulu_a7_5 (U1.V13)
CHAN27: zulu_a7_2 (X2.37), zulu_a7_5 (U1.T18)
CHAN28: zulu_a7_2 (X2.38), zulu_a7_5 (U1.T17)
CHAN-CLK: zulu_a7_2 (X2.2), zulu_a7_5 (U1.P18)
CKE: zulu_a7_3 (U3.37), zulu_a7_5 (U1.M2)
CLK-12M-FPGA: zulu_a7_4 (R25.2), zulu_a7_5 (U1.L17)
D0: zulu_a7_3 (R119.2), zulu_a7_5 (U1.V8)
D1: zulu_a7_3 (R120.2), zulu_a7_5 (U1.V7)
D2: zulu_a7_3 (R121.2), zulu_a7_5 (U1.W7)
D3: zulu_a7_3 (R122.2), zulu_a7_5 (U1.W6)
D4: zulu_a7_3 (R123.2), zulu_a7_5 (U1.U5)
D5: zulu_a7_3 (R124.2), zulu_a7_5 (U1.W5)
D6: zulu_a7_3 (R125.2), zulu_a7_5 (U1.V5)
D7: zulu_a7_3 (R126.2), zulu_a7_5 (U1.U4)
D8: zulu_a7_3 (R127.2), zulu_a7_5 (U1.L1)
D9: zulu_a7_3 (R128.2), zulu_a7_5 (U1.K3)
D10: zulu_a7_3 (R129.2), zulu_a7_5 (U1.K2)
D11: zulu_a7_3 (R130.2), zulu_a7_5 (U1.J1)
D12: zulu_a7_3 (R131.2), zulu_a7_5 (U1.J3)
D13: zulu_a7_3 (R132.2), zulu_a7_5 (U1.H1)
D14: zulu_a7_3 (R133.2), zulu_a7_5 (U1.A14)
D15: zulu_a7_3 (R134.2), zulu_a7_5 (U1.A15)
FLASH-CS#: zulu_a7_3 (R7.1 U4.1), zulu_a7_5 (U1.K19)
FLASH-D00: zulu_a7_3 (U4.5), zulu_a7_5 (U1.D18)
FLASH-D01: zulu_a7_3 (U4.2), zulu_a7_5 (U1.D19)
FLASH-D02: zulu_a7_3 (R2.1 U4.3), zulu_a7_5 (U1.G18)
FLASH-D03: zulu_a7_3 (R6.1 U4.7), zulu_a7_5 (U1.F18)
FPGA-CCLK: zulu_a7_3 (U4.6), zulu_a7_5 (U1.C11)
FPGA-DONE: zulu_a7_4 (R4.7 R4.15), zulu_a7_5 (U1.U12)
FPGA-INIT#: zulu_a7_4 (R1.1), zulu_a7_5 (U1.U11)
FPGA-TCK: zulu_a7_4 (R4.11 R5.2), zulu_a7_5 (U1.C8)
FPGA-TDI: zulu_a7_4 (R4.14), zulu_a7_5 (U1.W10)
FPGA-TDO: zulu_a7_4 (R4.13), zulu_a7_5 (U1.W8)
FPGA-TMS: zulu_a7_4 (R4.12), zulu_a7_5 (U1.W9)
FT-PWREN#: zulu_a7_4 (U2.60), zulu_a7_5 (U1.P19)
LDQM: zulu_a7_3 (U3.15), zulu_a7_5 (U1.W4)
LED0_B: zulu_a7_2 (LD0.2), zulu_a7_5 (U1.N17)
LED0_G: zulu_a7_2 (LD0.6), zulu_a7_5 (U1.R18)
LED0_R: zulu_a7_2 (LD0.4), zulu_a7_5 (U1.P17)
LED1: zulu_a7_2 (R83.1), zulu_a7_5 (U1.N18)
LED2: zulu_a7_2 (R84.1), zulu_a7_5 (U1.M19)
RAS#: zulu_a7_3 (U3.18), zulu_a7_5 (U1.V3)
RST#: zulu_a7_2 (X2.23), zulu_a7_4 (R1.2 R4.16), zulu_a7_5 (U1.V10)
SD-CLK: zulu_a7_3 (X3.5), zulu_a7_5 (U1.U8)
SD-CMD: zulu_a7_3 (R35.1 X3.3), zulu_a7_5 (U1.U7)
SD-DAT0: zulu_a7_3 (R34.1 X3.7), zulu_a7_5 (U1.C15)
SD-DAT1: zulu_a7_3 (R34.2 X3.8), zulu_a7_5 (U1.B15)
SD-DAT2: zulu_a7_3 (R34.3 X3.1), zulu_a7_5 (U1.L3)
SD-DAT3: zulu_a7_3 (R34.4 X3.2), zulu_a7_5 (U1.A16)
SDRAM-CLK: zulu_a7_3 (U3.38), zulu_a7_5 (U1.M1)
SDRAM-CS#: zulu_a7_3 (U3.19), zulu_a7_5 (U1.W2)
UART_FT_CTS#: zulu_a7_4 (R93.1 U2.41), zulu_a7_5 (U1.B16)
UART_FT_DTR#: zulu_a7_4 (U2.43), zulu_a7_5 (U1.M18)
UART_FT_RTS#: zulu_a7_4 (U2.40), zulu_a7_5 (U1.L18)
UART_FT_RXD: zulu_a7_4 (R94.1 U2.39), zulu_a7_5 (U1.G19)
UART_FT_TXD: zulu_a7_4 (U2.38), zulu_a7_5 (U1.K17)
UDQM: zulu_a7_3 (U3.39), zulu_a7_5 (U1.L2)
USB_D_N: zulu_a7_1 (X1.2), zulu_a7_4 (U2.7)
USB_D_P: zulu_a7_1 (X1.3), zulu_a7_4 (U2.8)
VU: zulu_a7_1 (16 pins), zulu_a7_2 (X2.22)
WE#: zulu_a7_3 (U3.16), zulu_a7_5 (U1.V4)